# Altium project ArmBand-Control-Board.PrjPcb (part 1 of 3)
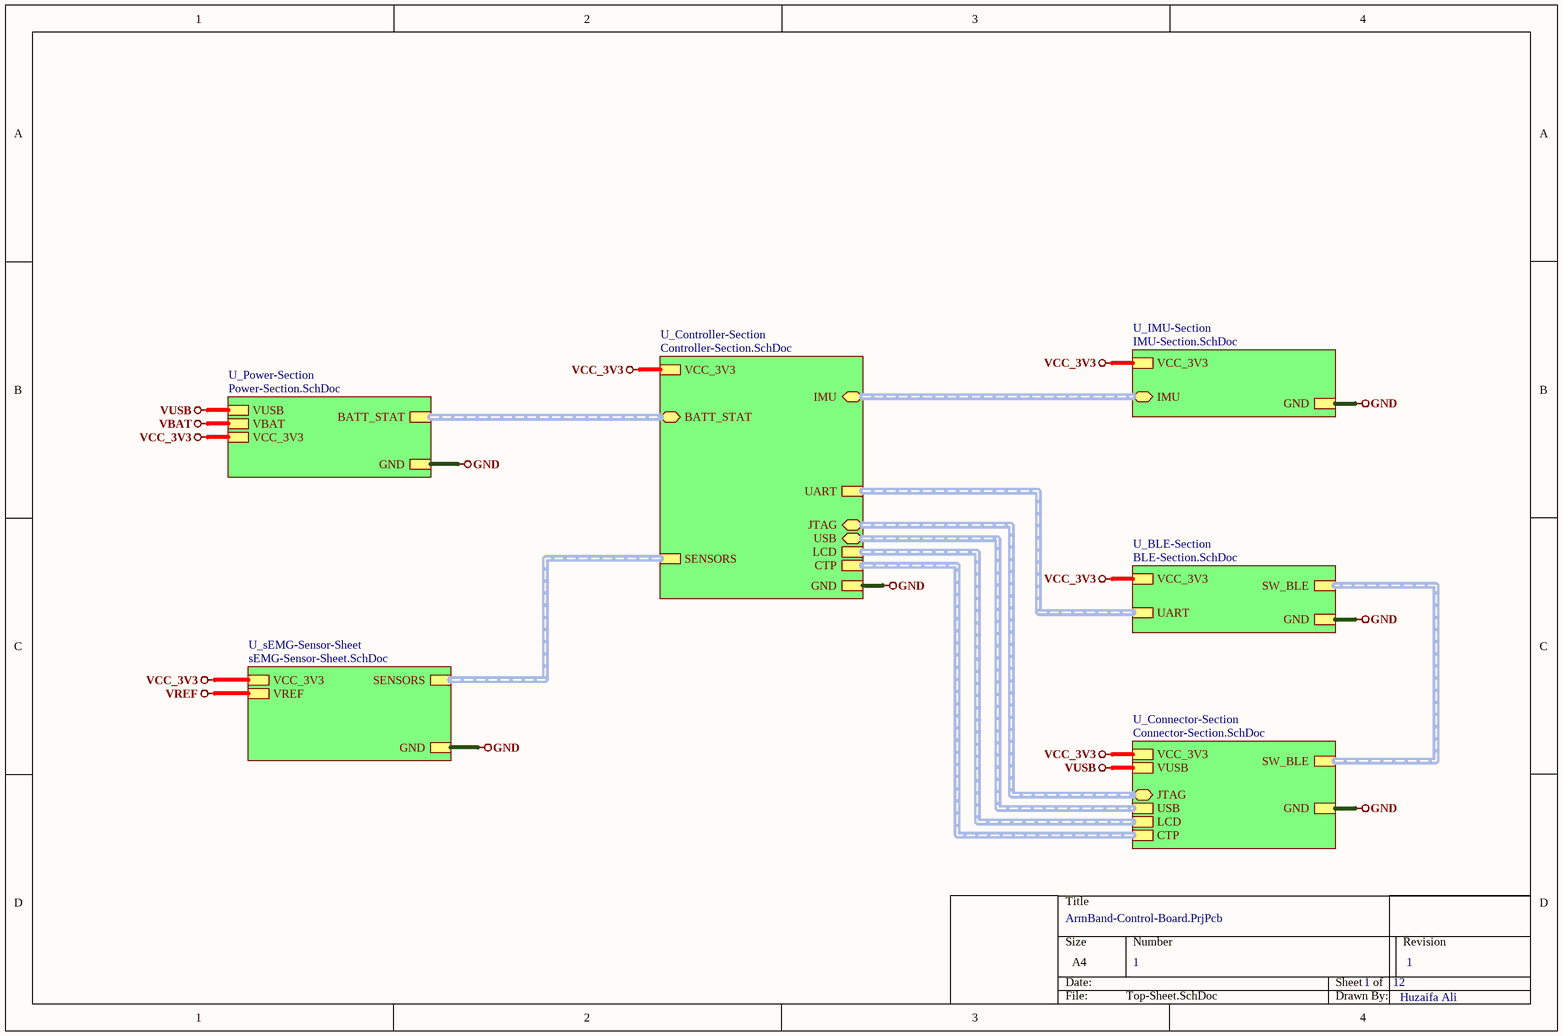
[diagram p0: Top-Sheet.SchDoc]
12 sheets, 184 parts. Net scope: hierarchical (ports join the sheet entries above them; power ports are global).
Board file: ArmBand-Control-Board.PcbDoc
Sheets:
  Top-Sheet.SchDoc
    U_Power-Section = Power-Section.SchDoc
      U_Switching-Regulators = Switching-Regulators.SchDoc
      U_Battery-Charging-Section = Battery-Charging-Section.SchDoc
    U_Controller-Section = Controller-Section.SchDoc
    U_IMU-Section = IMU-Section.SchDoc
    U_BLE-Section = BLE-Section.SchDoc
    U_Connector-Section = Connector-Section.SchDoc
    U_sEMG-Sensor-Sheet = sEMG-Sensor-Sheet.SchDoc
      U_Opamp-Sheet1 = Opamp-Sheet1.SchDoc
      U_Opamp-Sheet2 = Opamp-Sheet2.SchDoc
      U_Filter-Section = Filter-Section.SchDoc

## Sheet Top-Sheet.SchDoc
size A4; SheetNumber: 1; SheetTotal: 12

### Sub-sheets
U_BLE-Section = BLE-Section.SchDoc: UART (harness UART), SW_BLE (harness SW_BLE), VCC_3V3, GND
U_Connector-Section = Connector-Section.SchDoc: SW_BLE (harness SW_BLE), USB (harness USB), VCC_3V3, GND, VUSB, JTAG (bidir, harness JTAG), LCD (harness LCD), CTP (harness CTP)
U_Controller-Section = Controller-Section.SchDoc: BATT_STAT (bidir, harness BATT_STAT), IMU (bidir, harness IMU), USB (bidir, harness USB), VCC_3V3, GND, UART (harness UART), JTAG (bidir, harness JTAG), LCD (harness LCD), CTP (harness CTP), SENSORS (harness SENSORS)
U_IMU-Section = IMU-Section.SchDoc: IMU (bidir, harness IMU), VCC_3V3, GND
U_Power-Section = Power-Section.SchDoc: VUSB, GND, VBAT, VCC_3V3, BATT_STAT (harness BATT_STAT)
U_sEMG-Sensor-Sheet = sEMG-Sensor-Sheet.SchDoc: VCC_3V3, GND, VREF, SENSORS (harness SENSORS)

### Nets
GND: sheet U_Power-Section/GND, sheet U_Controller-Section/GND, sheet U_IMU-Section/GND, sheet U_BLE-Section/GND, sheet U_Connector-Section/GND, sheet U_sEMG-Sensor-Sheet/GND
VCC_3V3: sheet U_Power-Section/VCC_3V3, sheet U_Controller-Section/VCC_3V3, sheet U_IMU-Section/VCC_3V3, sheet U_BLE-Section/VCC_3V3, sheet U_Connector-Section/VCC_3V3, sheet U_sEMG-Sensor-Sheet/VCC_3V3
VUSB: sheet U_Power-Section/VUSB, sheet U_Connector-Section/VUSB

### Buses and harness runs
harness sheet U_BLE-Section/SW_BLE = sheet U_Connector-Section/SW_BLE
harness sheet U_BLE-Section/UART = sheet U_Controller-Section/UART
harness sheet U_Connector-Section/CTP = sheet U_Controller-Section/CTP
harness sheet U_Connector-Section/JTAG = sheet U_Controller-Section/JTAG
harness sheet U_Connector-Section/LCD = sheet U_Controller-Section/LCD
harness sheet U_Connector-Section/USB = sheet U_Controller-Section/USB
harness sheet U_Controller-Section/BATT_STAT = sheet U_Power-Section/BATT_STAT
harness sheet U_Controller-Section/IMU = sheet U_IMU-Section/IMU
harness sheet U_Controller-Section/SENSORS = sheet U_sEMG-Sensor-Sheet/SENSORS

### Notes on the sheet
- 1
- Huzaifa Ali

## Sheet Power-Section.SchDoc
size A4; SheetNumber: 2; SheetTotal: 12
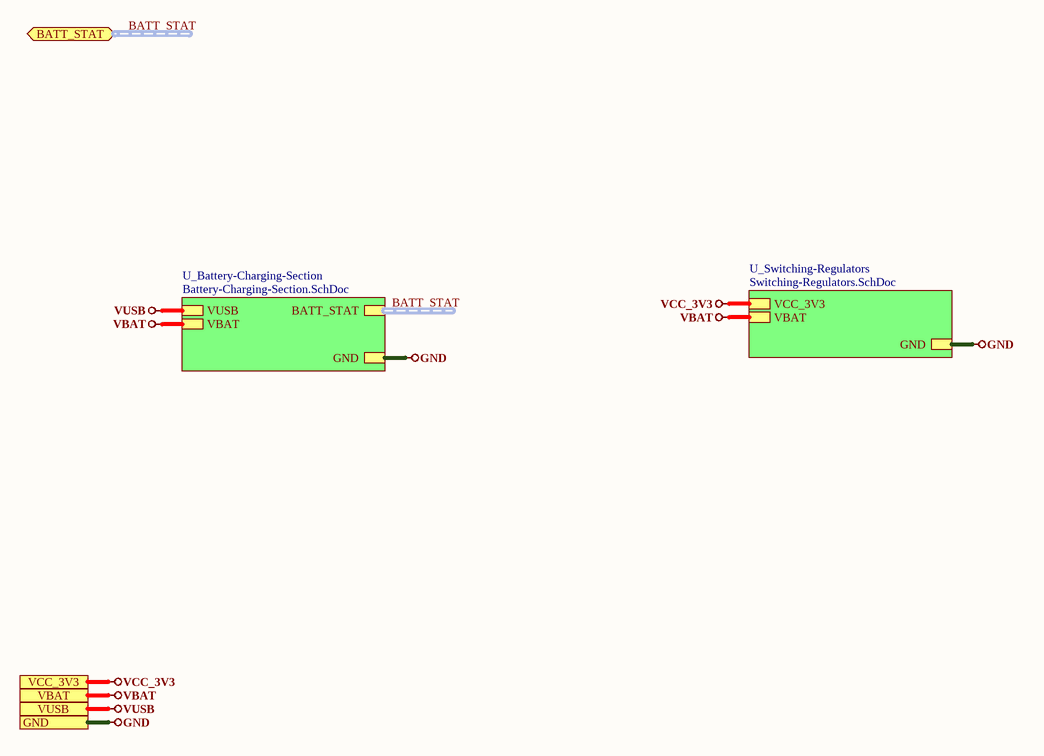
[diagram p1: Power-Section.SchDoc]

### Sub-sheets
U_Battery-Charging-Section = Battery-Charging-Section.SchDoc: BATT_STAT (harness BATT_STAT), VUSB, GND, VBAT
U_Switching-Regulators = Switching-Regulators.SchDoc: VCC_3V3, GND, VBAT

### Ports
BATT_STAT (bidir, harness BATT_STAT), GND, VBAT, VCC_3V3, VUSB

### Nets
GND: port GND, sheet U_Switching-Regulators/GND, sheet U_Battery-Charging-Section/GND
VBAT: port VBAT, sheet U_Switching-Regulators/VBAT, sheet U_Battery-Charging-Section/VBAT
VCC_3V3: port VCC_3V3, sheet U_Switching-Regulators/VCC_3V3
VUSB: port VUSB, sheet U_Battery-Charging-Section/VUSB

### Buses and harness runs
harness BATT_STAT = port BATT_STAT
harness BATT_STAT = sheet U_Battery-Charging-Section/BATT_STAT

### Notes on the sheet
- 1
- Huzaifa Ali

## Sheet Switching-Regulators.SchDoc
size A4; SheetNumber: 4; SheetTotal: 9
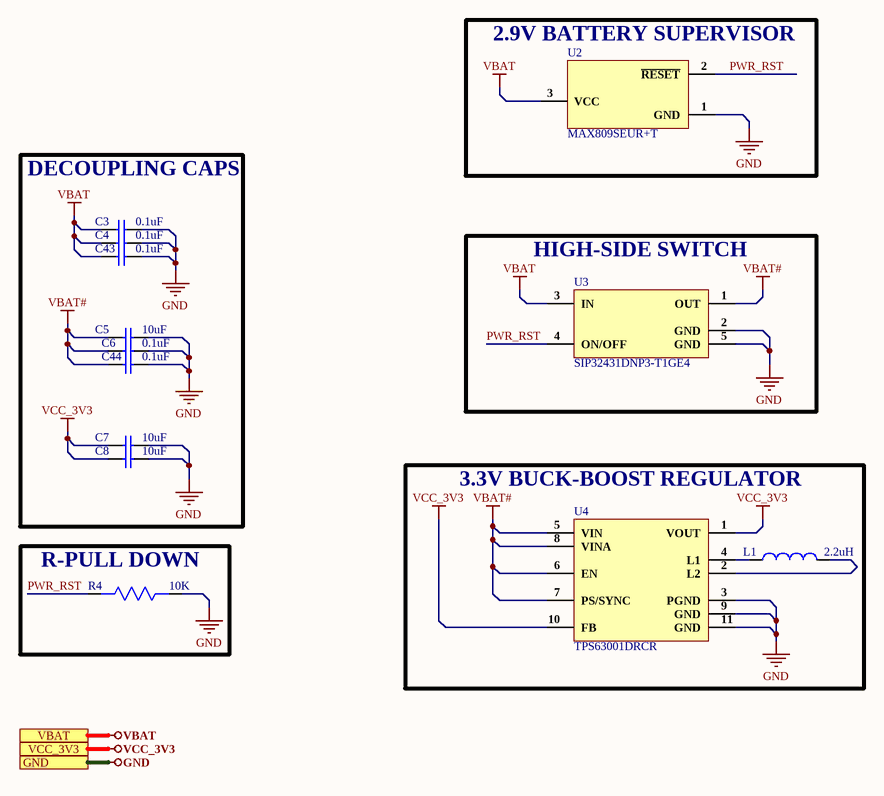
[diagram p2: Switching-Regulators.SchDoc]

### Parts
C3  0.1uF  [Cap 0402]
C4  0.1uF  [Cap 0402]
C5  10uF  [Cap0603]
C6  0.1uF  [Cap 0402]
C7  10uF  [Cap0603]
C8  10uF  [Cap0603]
C43  0.1uF  [Cap 0402]
C44  0.1uF  [Cap 0402]
L1  2.2uH  [MAKK2016T2R2M]
R4  10K  [Res0402]
U2  MAX809SEUR+T  [SOT-23]
U3  SIP32431DNP3-T1GE4  [4-TDFN (1.2x1.6)]
U4  TPS63001DRCR  [10-VSON (3x3)]

### Blocks framed on the sheet
2.9V BATTERY SUPERVISOR: U2
DECOUPLING CAPS: C3-C8 C43 C44
HIGH-SIDE SWITCH: U3
3.3V BUCK-BOOST REGULATOR: L1 U4
R-PULL DOWN: R4

### Ports
GND, VBAT, VCC_3V3

### Nets
GND: C3.2 C4.2 C5.2 C6.2 C7.2 C8.2 C43.2 C44.2 R4.1 U2.1(GND) U3.2(GND) U3.5(GND) U4.3(PGND) U4.9(GND) U4.11(GND) ; port GND
VBAT: C3.1 C4.1 C43.1 U2.3(VCC) U3.3(IN) ; port VBAT
VBAT#: C5.1 C6.1 C44.1 U3.1(OUT) U4.5(VIN) U4.6(EN) U4.7(PS/SYNC) U4.8(VINA)
VCC_3V3: C7.1 C8.1 U4.1(VOUT) U4.10(FB) ; port VCC_3V3
PWR_RST: R4.2 U2.2(~{RESET}) U3.4(ON/OFF)
NetL1_1: L1.1 U4.4(L1)
NetL1_2: L1.2 U4.2(L2)

### Notes on the sheet
- 1
- Huzaifa Ali

### Library data of the parts
C3 C4 C6 C43 C44 = GRM155R71H104ME14D: CAP CER 0.1UF 50V X7R 0402; Manufacturer: Murata; Tolerance: 20%; Capacitance: 100nF; Supplier 1: Digi-Key; Manufacturer Part Number: GRM155R71H104ME14D; Stock 1: 439844; Pricing 1: 1=0.1, 10=0.038, 100=0.0168, 500=0.01198, 1000=0.00941, 2500=0.00855, 5000=0.00787 (USD); Mount: Surface Mount; Case/Package: 0402; Min Operating Temperature: -55°C; Max Operating Temperature: 125°C; Packaging: Cut Tape; Voltage Rating: 50V; Length: 0.039inch; Width: 0.02inch; Thickness: 0.022inch; ComponentLink1URL: http://search.murata.co.jp/Ceramy/image/img/A01X/G101/ENG/GRM155R71H104ME14-01.pdf?src-supplier=Digi-Key; ComponentLink1Description: http://search.murata.co.jp/Ceramy/image/img/A01X/G101/ENG/GRM155R71H104ME14-01.pdf?src-supplier=Digi-Key; ComponentLink2URL: http://psearch.en.murata.com/capacitor/product/GRM155R71H104ME14%23.pdf?src-supplier=Avnet; ComponentLink2Description: http://psearch.en.murata.com/capacitor/product/GRM155R71H104ME14%23.pdf?src-supplier=Avnet; ComponentLink3URL: http://components.arrow.com/part/dataview/0323_07177683?src-supplier=Arrow+Europe; ComponentLink3Description: http://components.arrow.com/part/dataview/0323_07177683?src-supplier=Arrow+Europe; ComponentLink4URL: http://www.mouser.com/ds/2/281/c02e-2905.pdf?src-supplier=Mouser; ComponentLink4Description: http://www.mouser.com/ds/2/281/c02e-2905.pdf?src-supplier=Mouser; Supplier Part Number 1: 490-10701-1-ND
C5 C7 C8 = CL10A106MA8NRNC: CAP CER 10UF 25V X5R 0603; Manufacturer: Samsung; Tolerance: 20%; Supplier 1: Avnet; Manufacturer Part Number: CL10A106MA8NRNC; RoHS: Yes; Category: Ceramic Capacitors; Pricing 1: 4000=0.03753, 8000=0.03700, 16000=0.03595, 24000=0.03515, 32000=0.03383, 40000=0.03304, 400000=0.03225 (USD); Mount: Surface Mount; Case/Package: 0603; Case Code (Metric): 1608; Case Code (Imperial): 0603; Contact Plating: Tin; Min Operating Temperature: -55°C; Max Operating Temperature: 85°C; Package Quantity: 1; Packaging: Tape and Reel; Capacitance: 10uF; Voltage Rating: 25V; Dielectric: X5R; Termination: Wraparound; Series: CL; Construction: Flat; Length: 0.063inch; Width: 0.031inch; Thickness: 0.035inch; Lead Free: Lead Free; RoHS Compliant: Yes; ComponentLink1URL: https://datasheet.ciiva.com/25766/cl10a106ma8nrnc-25766562.pdf?src-supplier=Digi-Key; ComponentLink1Description: https://datasheet.ciiva.com/25766/cl10a106ma8nrnc-25766562.pdf?src-supplier=Digi-Key; Supplier Part Number 1: CL10A106MA8NRNC
L1 = MAKK2016T2R2M: FIXED IND 2.2UH 1.5A 160MOHM SMD; Manufacturer: Taiyo Yuden; Core Material: Metal; Tolerance: 20%; Shielding: Shielded; DC Resistance (DCR): 160mR; Test Frequency: 2MHz; Supplier 1: Mouser; Manufacturer Part Number: MAKK2016T2R2M; RoHS: Yes; Category: Fixed Inductors; Stock 1: 64320; Pricing 1: 1=0.27000, 10=0.17200, 50=0.17200, 100=0.14000, 1000=0.10600, 10000=0.09200 (USD); Mount: Surface Mount; Case/Package: 0806; Case Code (Metric): 2016; Case Code (Imperial): 0806; Min Operating Temperature: -40°C; Max Operating Temperature: 105°C; Packaging: Tape and Reel; Package Quantity: 3000; Resistor Type: Wirewound; Inductance: 2.2uH; Current Rating: 1.5A; Saturation Current: 1.5A; Max DC Current: 1.5A; Termination: SMD/SMT; Length: 0.079inch; Width: 0.063inch; Height: 1mm; Height - Seated (Max): 0.039inch; Depth: 1.6mm; Radiation Hardening: No; Halogen Free: Halogen Free; RoHS Compliant: Yes; ComponentLink1URL: https://datasheet.ciiva.com/30014/makk2016t2r2m-ss-30014449.pdf?src-supplier=Avnet; ComponentLink1Description: https://datasheet.ciiva.com/30014/makk2016t2r2m-ss-30014449.pdf?src-supplier=Avnet; Supplier Part Number 1: 963-MAKK2016T2R2M
R4 = RC0402FR-0710KL: RES SMD 10K OHM 1% 1/16W 0402; Manufacturer: Yageo; Resistance: 10kR; Temperature Coefficient: 100ppm/°C; Voltage Rating (DC): 50V; Power Rating: 62.5mW; Supplier 1: Digi-Key; Manufacturer Part Number: RC0402FR-0710KL; Stock 1: 60122563; Pricing 1: 1=0.1, 10=0.016, 100=0.0064, 1000=0.00289, 2500=0.00251, 5000=0.00207 (USD); Case/Package: 0402; Number of Pins: 2; Case Code (Imperial): 0402; Case Code (Metric): 1005; Min Operating Temperature: -55°C; Max Operating Temperature: 155°C; Composition: Thick Film; Tolerance: 1%; Packaging: Tape and Reel; Voltage Rating: 50V; Termination: SMD/SMT; Military Standard: Not; Working Voltage: 50V; Number of Terminations: 2; Length: 1mm; Height: 0.32mm; Width: 0.5mm; Depth: 0.5mm; Lead Pitch: 0.2mm; REACH SVHC: No SVHC; Lead Free: Lead Free; ComponentLink1URL: http://www.farnell.com/datasheets/2167052.pdf?src-supplier=Element14; ComponentLink1Description: http://www.farnell.com/datasheets/2167052.pdf?src-supplier=Element14; ComponentLink2URL: http://www.farnell.com/datasheets/1686128.pdf?src-supplier=Element14; ComponentLink2Description: http://www.farnell.com/datasheets/1686128.pdf?src-supplier=Element14; ComponentLink3URL: http://www.farnell.com/datasheets/1784430.pdf?src-supplier=Element14; ComponentLink3Description: http://www.farnell.com/datasheets/1784430.pdf?src-supplier=Element14; ComponentLink4URL: http://www.yageo.com/documents/recent/PYu-RC_Group_51_RoHS_L_9.pdf?src-supplier=Mouser; ComponentLink4Description: http://www.yageo.com/documents/recent/PYu-RC_Group_51_RoHS_L_9.pdf?src-supplier=Mouser; Supplier Part Number 1: 311-10.0KLRDKR-ND
U2 = MAX809SEUR+T: IC MPU/RESET CIRC SOT23-3; Manufacturer: Maxim; Min Supply Voltage: 1.2V; Max Supply Voltage: 5.5V; Max Power Dissipation: 320mW; Number of Voltages Monitored: 1; Reset: Active Low; Reset Timeout: 140ms; Threshold Voltage: 2.93V; Watchdog Timer: No; Min Reset Threshold Voltage: 2.89V; Max Reset Threshold Voltage: 2.96V; Output: TOTEM-POLE; Operating Supply Current: 60uA; Max Output Current: 20mA; Nominal Supply Current: 17uA; Output Type: PUSH-PULL; Supplier 1: Mouser; Manufacturer Part Number: MAX809SEUR+T; RoHS: Yes; Category: Voltage Supervisors; Stock 1: 26180; Pricing 1: 1=3.68000, 10=3.31000, 25=3.13000, 50=3.13000, 100=2.72000, 250=2.58000, 500=2.31000, 1000=2.09000, 10000=2.01000 (USD); Mount: Surface Mount; Case/Package: SOT-23; Number of Pins: 3; Min Operating Temperature: -40°C; Max Operating Temperature: 105°C; Type: Simple Reset/Power-On Reset; Packaging: Cut Tape; Package Quantity: 1; Series: -; Overvoltage Threshold: 2.96V; Undervoltage Threshold: 2.89V; Termination: SMD/SMT; Power Dissipation: 320mW; Length: 2.92mm; Width: 1.3mm; Height: 0.94mm; Radiation Hardening: No; Lead Free: Lead Free; RoHS Compliant: Yes; REACH SVHC: No SVHC; ComponentLink1URL: https://datasheet.ciiva.com/1169/max803-max810z-1169879.pdf?src-supplier=Element14; ComponentLink1Description: https://datasheet.ciiva.com/1169/max803-max810z-1169879.pdf?src-supplier=Element14; ComponentLink2URL: https://datasheet.ciiva.com/1169/max803-max810z-1169878.pdf?src-supplier=Element14; ComponentLink2Description: https://datasheet.ciiva.com/1169/max803-max810z-1169878.pdf?src-supplier=Element14; ComponentLink3URL: https://datasheet.ciiva.com/14226/max803-max810z-14226330.pdf?src-supplier=Avnet; ComponentLink3Description: https://datasheet.ciiva.com/14226/max803-max810z-14226330.pdf?src-supplier=Avnet; ComponentLink4URL: https://datasheet.ciiva.com/1973/max803-max810z-1973322.pdf?src-supplier=Digi-Key; ComponentLink4Description: https://datasheet.ciiva.com/1973/max803-max810z-1973322.pdf?src-supplier=Digi-Key; ComponentLink5URL: https://datasheet.ciiva.com/1973/max803-max810z-1973323.pdf?src-supplier=Digi-Key; ComponentLink5Description: https://datasheet.ciiva.com/1973/max803-max810z-1973323.pdf?src-supplier=Digi-Key; ComponentLink6URL: https://datasheet.ciiva.com/1973/max803-max810z-1973321.pdf?src-supplier=Digi-Key; ComponentLink6Description: https://datasheet.ciiva.com/1973/max803-max810z-1973321.pdf?src-supplier=Digi-Key; Supplier Part Number 1: 700-MAX809SEURT
U3 = SIP32431DNP3-T1GE4: IC SWITCH HIGH SIDE 4TDFN; Manufacturer: Vishay Siliconix; Output Current: 1A; Number of Outputs: 1; Max Power Dissipation: 324mW; Max Supply Voltage: 5.5V; Min Supply Voltage: 1.1V; Interface: On/Off; Max Output Current: 1.4A; On-State Resistance: 520mR; Turn-Off Delay Time: 10us; Turn-On Delay Time: 40us; Fault Protection: Reverse Current; Supplier 1: Arrow Electronics; Manufacturer Part Number: SIP32431DNP3-T1GE4; RoHS: Yes; Category: Hot Swap Controllers; Stock 1: 2913; Pricing 1: 1=0.66250, 10=0.57780, 25=0.57210, 100=0.43730, 250=0.41140, 500=0.34220, 1000=0.27210, 3000=0.25500 (USD); Mount: Surface Mount; Number of Pins: 4; Weight: 0.001764oz; Min Operating Temperature: -40°C; Max Operating Temperature: 85°C; Packaging: Tape and Reel; Package Quantity: 3000; Power Dissipation: 324mW; Output Configuration: High Side; Series: SIP324x1; Radiation Hardening: No; Lead Free: Lead Free; RoHS Compliant: Yes; ComponentLink1URL: https://datasheet.ciiva.com/15109/getdatasheetpartid-704627-15109219.pdf?src-supplier=Verical; ComponentLink1Description: https://datasheet.ciiva.com/15109/getdatasheetpartid-704627-15109219.pdf?src-supplier=Verical; ComponentLink2URL: https://datasheet.ciiva.com/1954/sip32431-1954885.pdf?src-supplier=Digi-Key; ComponentLink2Description: https://datasheet.ciiva.com/1954/sip32431-1954885.pdf?src-supplier=Digi-Key; Supplier Part Number 1: SIP32431DNP3-T1GE4
U4 = TPS63001DRCR: IC REG BUCK BST 3.3V 1.6A 10SON; Manufacturer: Texas Instruments; Switching Frequency: 1.5MHz; Efficiency: 96%; Number of Outputs: 1; Output Current: 1.2A; Max Input Voltage: 5.5V; Min Input Voltage: 1.8V; Synchronous Rectifier: Yes; Quiescent Current: 30uA; Output Type: Fixed; Topology: Buck-Boost; Supplier 1: Mouser; Manufacturer Part Number: TPS63001DRCR; RoHS: Yes; Category: Voltage Regulators - Switching; Pricing 1: 1=2.67000, 10=2.41000, 50=2.27000, 100=1.94000, 1000=1.32000, 10000=1.32000 (USD); Number of Pins: 10; Weight: 0.000921oz; Contact Plating: Gold; Min Operating Temperature: -40°C; Max Operating Temperature: 85°C; Packaging: Tape and Reel; Output Voltage: 3.3V; Package Quantity: 1; Max Output Current: 1.2A; Min Output Voltage: 3.3V; Max Output Voltage: 3.3V; Operating Supply Voltage: 5.5V; Nominal Output Voltage: 3.3V; Radiation Hardening: No; Lead Free: Lead Free; RoHS Compliant: Yes; REACH SVHC: No SVHC; ComponentLink1URL: https://datasheet.ciiva.com/2025/tps63001-2025809.pdf?src-supplier=Digi-Key; ComponentLink1Description: https://datasheet.ciiva.com/2025/tps63001-2025809.pdf?src-supplier=Digi-Key; ComponentLink2URL: https://datasheet.ciiva.com/3220/slvs520b-3220364.pdf?src-supplier=Avnet; ComponentLink2Description: https://datasheet.ciiva.com/3220/slvs520b-3220364.pdf?src-supplier=Avnet; ComponentLink3URL: https://datasheet.ciiva.com/15113/getdatasheetpartid-188339-15113751.pdf?src-supplier=Verical; ComponentLink3Description: https://datasheet.ciiva.com/15113/getdatasheetpartid-188339-15113751.pdf?src-supplier=Verical; ComponentLink4URL: https://datasheet.ciiva.com/41462/001014938-da-01-en-ic-reg-buck-bst-tps63001drcr-vson-10-tid-41462783.pdf?src-supplier=Conrad; ComponentLink4Description: https://datasheet.ciiva.com/41462/001014938-da-01-en-ic-reg-buck-bst-tps63001drcr-vson-10-tid-41462783.pdf?src-supplier=Conrad; ComponentLink5URL: https://datasheet.ciiva.com/7994/1831174-7994044.pdf?src-supplier=Element14; ComponentLink5Description: https://datasheet.ciiva.com/7994/1831174-7994044.pdf?src-supplier=Element14; ComponentLink6URL: https://datasheet.ciiva.com/46394/1854797-46394566.pdf?src-supplier=Element14; ComponentLink6Description: https://datasheet.ciiva.com/46394/1854797-46394566.pdf?src-supplier=Element14; ComponentLink7URL: https://datasheet.ciiva.com/2025/tps63001-2025813.pdf?src-supplier=Digi-Key; ComponentLink7Description: https://datasheet.ciiva.com/2025/tps63001-2025813.pdf?src-supplier=Digi-Key; ComponentLink8URL: https://datasheet.ciiva.com/2025/tps63001-2025812.pdf?src-supplier=Digi-Key; ComponentLink8Description: https://datasheet.ciiva.com/2025/tps63001-2025812.pdf?src-supplier=Digi-Key; ComponentLink9URL: https://datasheet.ciiva.com/3220/tps63001-3220363.pdf?src-supplier=Avnet; ComponentLink9Description: https://datasheet.ciiva.com/3220/tps63001-3220363.pdf?src-supplier=Avnet; Supplier Part Number 1: 595-TPS63001DRCR

## Sheet Battery-Charging-Section.SchDoc
size A4; SheetNumber: 3; SheetTotal: 12
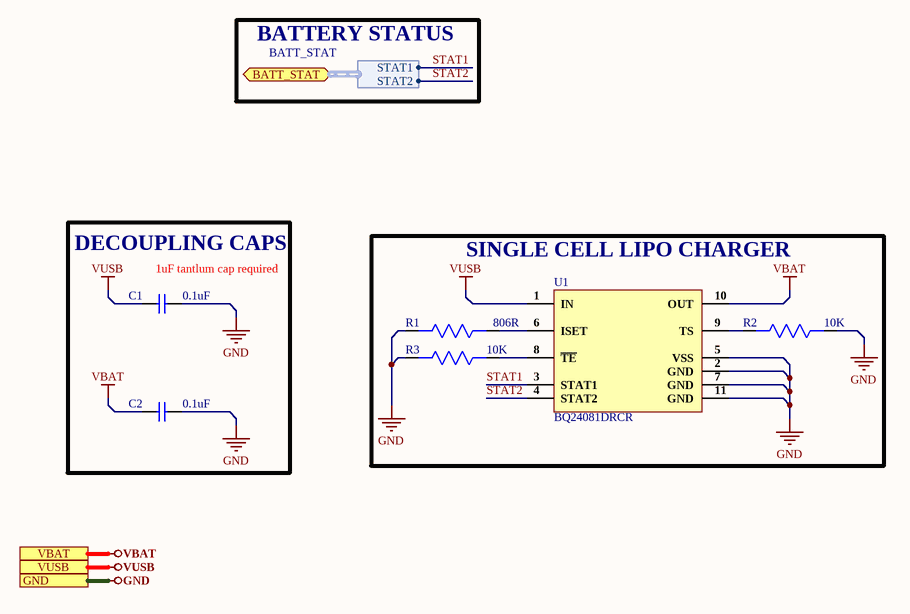
[diagram p3: Battery-Charging-Section.SchDoc]

### Parts
C1  0.1uF  [Cap 0402]
C2  0.1uF  [Cap 0402]
R1  806R  [Res0402]
R2  10K  [Res0402]
R3  10K  [Res0402]
U1  BQ24081DRCR  [10-VSON (3x3)]

### Blocks framed on the sheet
DECOUPLING CAPS: C1 C2
SINGLE CELL LIPO CHARGER: R1-R3 U1

### Ports
BATT_STAT (bidir, harness BATT_STAT), GND, VBAT, VUSB

### Harnesses
BATT_STAT: STAT1, STAT2

### Nets
GND: C1.2 C2.2 R1.2 R2.1 R3.2 U1.2(GND) U1.5(VSS) U1.7(GND) U1.11(GND) ; port GND
VBAT: C2.1 U1.10(OUT) ; port VBAT
VUSB: C1.1 U1.1(IN) ; port VUSB
STAT1: U1.3(STAT1) ; port BATT_STAT.STAT1  [project net BATT_STAT.STAT1]
STAT2: U1.4(STAT2) ; port BATT_STAT.STAT2  [project net BATT_STAT.STAT2]
NetR1_1: R1.1 U1.6(ISET)
NetR2_2: R2.2 U1.9(TS)
NetR3_1: R3.1 U1.8(~{TE})

### Notes on the sheet
- BATTERY STATUS
- (near C1) 1uF tantlum cap required
- 1
- Huzaifa Ali

### Library data of the parts
C1 C2 = GRM155R71H104ME14D: as C3 on sheet Switching-Regulators; Supplier 1: Digi-Key; Manufacturer Part Number: GRM155R71H104ME14D; Stock 1: 439844; Pricing 1: 1=0.1, 10=0.038, 100=0.0168, 500=0.01198, 1000=0.00941, 2500=0.00855, 5000=0.00787 (USD); Mount: Surface Mount; Case/Package: 0402; Min Operating Temperature: -55°C; Max Operating Temperature: 125°C; Packaging: Cut Tape; Voltage Rating: 50V; Length: 0.039inch; Width: 0.02inch; Thickness: 0.022inch; ComponentLink1URL: http://search.murata.co.jp/Ceramy/image/img/A01X/G101/ENG/GRM155R71H104ME14-01.pdf?src-supplier=Digi-Key; ComponentLink1Description: http://search.murata.co.jp/Ceramy/image/img/A01X/G101/ENG/GRM155R71H104ME14-01.pdf?src-supplier=Digi-Key; ComponentLink2URL: http://psearch.en.murata.com/capacitor/product/GRM155R71H104ME14%23.pdf?src-supplier=Avnet; ComponentLink2Description: http://psearch.en.murata.com/capacitor/product/GRM155R71H104ME14%23.pdf?src-supplier=Avnet; ComponentLink3URL: http://components.arrow.com/part/dataview/0323_07177683?src-supplier=Arrow+Europe; ComponentLink3Description: http://components.arrow.com/part/dataview/0323_07177683?src-supplier=Arrow+Europe; ComponentLink4URL: http://www.mouser.com/ds/2/281/c02e-2905.pdf?src-supplier=Mouser; ComponentLink4Description: http://www.mouser.com/ds/2/281/c02e-2905.pdf?src-supplier=Mouser; Supplier Part Number 1: 490-10701-1-ND
R1 = AC0402FR-07806RL: RES SMD 806 OHM 1% 1/16W 0402; Manufacturer: Yageo; Max Power Dissipation: 63mW; Temperature Coefficient: 100ppm/°C; Supplier 1: Arrow Electronics; Manufacturer Part Number: AC0402FR-07806RL; RoHS: Yes; Category: Chip SMD Resistors; Stock 1: 6997; Pricing 1: 1=0.04340, 10=0.00890, 25=0.00880, 100=0.00370, 250=0.00360, 1000=0.00210, 3000=0.00140, 6000=0.00110 (USD); Case/Package: 0402; Min Operating Temperature: -55°C; Max Operating Temperature: 155°C; Packaging: Tape and Reel; Resistance: 806R; Resistor Type: Thick Film; Number of Terminations: 2; Tolerance: 1%; Features: Moisture Resistant,Automotive AEC-Q200; Length: 0.039inch; Width: 0.02inch; Height: 0.015inch; RoHS Compliant: Yes; ComponentLink1URL: http://www.yageo.com/NewPortal/yageodocoutput?fileName=/pdf/R-Chip/PYu-AC_51_RoHS_L_6.pdf&src-supplier=Digi-Key; ComponentLink1Description: http://www.yageo.com/NewPortal/yageodocoutput?fileName=/pdf/R-Chip/PYu-AC_51_RoHS_L_6.pdf&src-supplier=Digi-Key; ComponentLink2URL: https://www.yageo.com/upload/media/product/productsearch/datasheet/rchip/PYu-AC_51_RoHS_L_7.pdf?src-supplier=Digi-Key; ComponentLink2Description: https://www.yageo.com/upload/media/product/productsearch/datasheet/rchip/PYu-AC_51_RoHS_L_7.pdf?src-supplier=Digi-Key; Supplier Part Number 1: AC0402FR-07806RL
R2 R3 = RC0402FR-0710KL: as R4 on sheet Switching-Regulators; Supplier 1: Digi-Key; Manufacturer Part Number: RC0402FR-0710KL; Stock 1: 60122563; Pricing 1: 1=0.1, 10=0.016, 100=0.0064, 1000=0.00289, 2500=0.00251, 5000=0.00207 (USD); Case/Package: 0402; Number of Pins: 2; Case Code (Imperial): 0402; Case Code (Metric): 1005; Min Operating Temperature: -55°C; Max Operating Temperature: 155°C; Composition: Thick Film; Tolerance: 1%; Packaging: Tape and Reel; Voltage Rating: 50V; Termination: SMD/SMT; Military Standard: Not; Working Voltage: 50V; Number of Terminations: 2; Length: 1mm; Height: 0.32mm; Width: 0.5mm; Depth: 0.5mm; Lead Pitch: 0.2mm; REACH SVHC: No SVHC; Lead Free: Lead Free; ComponentLink1URL: http://www.farnell.com/datasheets/2167052.pdf?src-supplier=Element14; ComponentLink1Description: http://www.farnell.com/datasheets/2167052.pdf?src-supplier=Element14; ComponentLink2URL: http://www.farnell.com/datasheets/1686128.pdf?src-supplier=Element14; ComponentLink2Description: http://www.farnell.com/datasheets/1686128.pdf?src-supplier=Element14; ComponentLink3URL: http://www.farnell.com/datasheets/1784430.pdf?src-supplier=Element14; ComponentLink3Description: http://www.farnell.com/datasheets/1784430.pdf?src-supplier=Element14; ComponentLink4URL: http://www.yageo.com/documents/recent/PYu-RC_Group_51_RoHS_L_9.pdf?src-supplier=Mouser; ComponentLink4Description: http://www.yageo.com/documents/recent/PYu-RC_Group_51_RoHS_L_9.pdf?src-supplier=Mouser; Supplier Part Number 1: 311-10.0KLRDKR-ND
U1 = BQ24081DRCR: IC BATT CHG LI-ION 1CELL 10VSON; Manufacturer: Texas Instruments; Output Voltage: 4.2V; Min Supply Voltage: 4.5V; Max Supply Voltage: 6.5V; Output Current: 1A; Number of Cells: 1; Supplier 1: Mouser; Manufacturer Part Number: BQ24081DRCR; RoHS: Yes; Category: Battery Management; Pricing 1: 1=1.80000, 10=1.62000, 50=1.53000, 100=1.31000, 1000=0.88800, 10000=0.88700 (USD); Mount: Surface Mount; Case/Package: VSON; Number of Pins: 10; Weight: 0.000921oz; Contact Plating: Gold; Min Operating Temperature: -40°C; Max Operating Temperature: 125°C; Package Quantity: 1; Packaging: Tape and Reel; Series: -; Radiation Hardening: No; Lead Free: Lead Free; RoHS Compliant: Yes; ComponentLink1URL: https://datasheet.ciiva.com/15114/getdatasheetpartid-418523-15114727.pdf?src-supplier=Verical; ComponentLink1Description: https://datasheet.ciiva.com/15114/getdatasheetpartid-418523-15114727.pdf?src-supplier=Verical; ComponentLink2URL: https://datasheet.ciiva.com/1932/bq24081-1932210.pdf?src-supplier=Digi-Key; ComponentLink2Description: https://datasheet.ciiva.com/1932/bq24081-1932210.pdf?src-supplier=Digi-Key; ComponentLink3URL: https://datasheet.ciiva.com/1932/bq24081-1932209.pdf?src-supplier=Digi-Key; ComponentLink3Description: https://datasheet.ciiva.com/1932/bq24081-1932209.pdf?src-supplier=Digi-Key; ComponentLink4URL: https://datasheet.ciiva.com/1932/bq24081-1932211.pdf?src-supplier=Digi-Key; ComponentLink4Description: https://datasheet.ciiva.com/1932/bq24081-1932211.pdf?src-supplier=Digi-Key; ComponentLink5URL: https://datasheet.ciiva.com/3214/bq24080-3214060.pdf?src-supplier=Avnet; ComponentLink5Description: https://datasheet.ciiva.com/3214/bq24080-3214060.pdf?src-supplier=Avnet; Supplier Part Number 1: 595-BQ24081DRCR

## Sheet Controller-Section.SchDoc
size A4; SheetNumber: 5; SheetTotal: 12
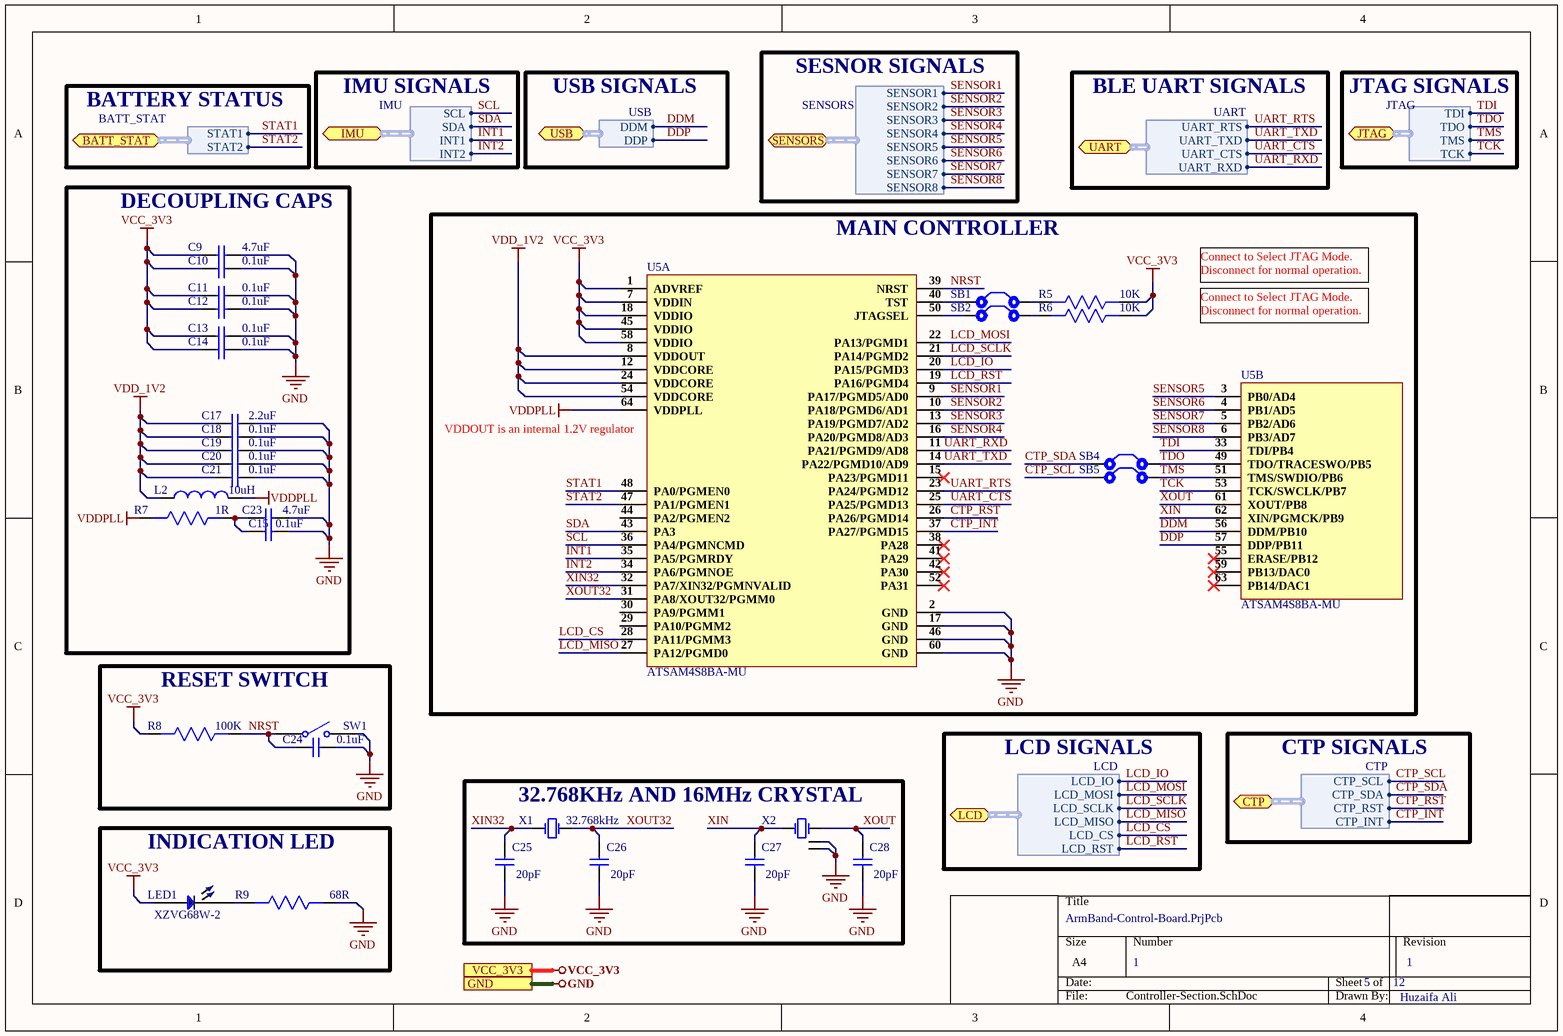
[diagram p4: Controller-Section.SchDoc]

### Parts
C9  4.7uF  [Cap 0402]
C10  0.1uF  [Cap 0402]
C11  0.1uF  [Cap 0402]
C12  0.1uF  [Cap 0402]
C13  0.1uF  [Cap 0402]
C14  0.1uF  [Cap 0402]
C15  0.1uF  [Cap 0402]
C17  2.2uF  [Cap 0402]
C18  0.1uF  [Cap 0402]
C19  0.1uF  [Cap 0402]
C20  0.1uF  [Cap 0402]
C21  0.1uF  [Cap 0402]
C23  4.7uF  [Cap 0402]
C24  0.1uF  [Cap 0402]
C25  20pF  [Cap 0402]
C26  20pF  [Cap 0402]
C27  20pF  [Cap 0402]
C28  20pF  [Cap 0402]
L2  10uH  [NLCV25T-100K-EFRD]
LED1  XZVG68W-2  [LED 0402]
R5  10K  [Res0402]
R6  10K  [Res0402]
R7  1R  [Res0402]
R8  100K  [Res0402]
R9  68R  [Res0402]
SB1  Solder Bridge  [Solder Bridge]  (value not drawn)
SB2  Solder Bridge  [Solder Bridge]  (value not drawn)
SB4  Solder Bridge  [Solder Bridge]  (value not drawn)
SB5  Solder Bridge  [Solder Bridge]  (value not drawn)
SW1  TS-1185EC-C-D-B  [TS-1185EC-C-D-B]  (value not drawn)
U5  ATSAM4S8BA-MU  [QFN-64]  (parts A,B of 2)
X1  32.768kHz  [X321532768KGD2SI]
X2  16MHz  [X322516MOB4SI]  (value not drawn)

### Blocks framed on the sheet
DECOUPLING CAPS: C9-C15 C17-C21 C23 L2 R7
MAIN CONTROLLER: R5 R6 SB1 SB2 SB4 SB5 U5
RESET SWITCH: C24 R8 SW1
32.768KHz AND 16MHz CRYSTAL: C25-C28 X1 X2
INDICATION LED: LED1 R9

### Ports
BATT_STAT (bidir, harness BATT_STAT), CTP (bidir, harness CTP), GND, IMU (bidir, harness IMU), JTAG (bidir, harness JTAG), LCD (bidir, harness LCD), SENSORS (bidir, harness SENSORS), UART (bidir, harness UART), USB (bidir, harness USB), VCC_3V3

### Harnesses
IMU: SCL, SDA, INT1, INT2
USB: DDM, DDP
BATT_STAT: STAT1, STAT2
JTAG: TDI, TDO, TMS, TCK
LCD: LCD_IO, LCD_MOSI, LCD_SCLK, LCD_MISO, LCD_CS, LCD_RST
CTP: CTP_SCL, CTP_SDA, CTP_RST, CTP_INT
UART: UART_RTS, UART_TXD, UART_CTS, UART_RXD
SENSORS: SENSOR1, SENSOR2, SENSOR3, SENSOR4, SENSOR5, SENSOR6, SENSOR7, SENSOR8

### Nets
GND: C9.2 C10.2 C11.2 C12.2 C13.2 C14.2 C15.2 C17.2 C18.2 C19.2 C20.2 C21.2 C23.2 C24.2 C25.1 C26.1 C27.1 C28.1 R9.1 SW1.2 U5.2(GND) U5.17(GND) U5.46(GND) U5.60(GND) X2.2(GND) X2.4(GND) ; port GND
VCC_3V3: C9.1 C10.1 C11.1 C12.1 C13.1 C14.1 LED1.1 R5.1 R6.1 R8.2 U5.1(ADVREF) U5.7(VDDIN) U5.18(VDDIO) U5.45(VDDIO) U5.58(VDDIO) ; port VCC_3V3
VDD_1V2: C17.1 C18.1 C19.1 C20.1 C21.1 L2.1 U5.8(VDDOUT) U5.12(VDDCORE) U5.24(VDDCORE) U5.54(VDDCORE)
VDDPLL: L2.2 R7.2 U5.64(VDDPLL)
CTP_INT: U5.37(PA27/PGMD15) ; port CTP.CTP_INT
CTP_RST: U5.26(PA26/PGMD14) ; port CTP.CTP_RST
CTP_SCL: SB5.1 ; port CTP.CTP_SCL
CTP_SDA: SB4.1 ; port CTP.CTP_SDA
DDM: U5.56(DDM/PB10) ; port USB.DDM
DDP: U5.57(DDP/PB11) ; port USB.DDP
INT1: U5.35(PA5/PGMRDY) ; port IMU.INT1
INT2: U5.34(PA6/PGMNOE) ; port IMU.INT2
LCD_CS: U5.28(PA11/PGMM3) ; port LCD.LCD_CS
LCD_IO: U5.20(PA15/PGMD3) ; port LCD.LCD_IO
LCD_MISO: U5.27(PA12/PGMD0) ; port LCD.LCD_MISO
LCD_MOSI: U5.22(PA13/PGMD1) ; port LCD.LCD_MOSI
LCD_RST: U5.19(PA16/PGMD4) ; port LCD.LCD_RST
LCD_SCLK: U5.21(PA14/PGMD2) ; port LCD.LCD_SCLK
NRST: C24.1 R8.1 SW1.1 U5.39(NRST)
SCL: U5.36(PA4/PGMNCMD) ; port IMU.SCL
SDA: U5.43(PA3) ; port IMU.SDA
SENSOR1: U5.9(PA17/PGMD5/AD0) ; port SENSORS.SENSOR1
SENSOR2: U5.10(PA18/PGMD6/AD1) ; port SENSORS.SENSOR2
SENSOR3: U5.13(PA19/PGMD7/AD2) ; port SENSORS.SENSOR3
SENSOR4: U5.16(PA20/PGMD8/AD3) ; port SENSORS.SENSOR4
SENSOR5: U5.3(PB0/AD4) ; port SENSORS.SENSOR5
SENSOR6: U5.4(PB1/AD5) ; port SENSORS.SENSOR6
SENSOR7: U5.5(PB2/AD6) ; port SENSORS.SENSOR7
SENSOR8: U5.6(PB3/AD7) ; port SENSORS.SENSOR8
STAT1: U5.48(PA0/PGMEN0) ; port BATT_STAT.STAT1  [project net BATT_STAT.STAT1]
STAT2: U5.47(PA1/PGMEN1) ; port BATT_STAT.STAT2  [project net BATT_STAT.STAT2]
TCK: U5.53(TCK/SWCLK/PB7) ; port JTAG.TCK
TDI: U5.33(TDI/PB4) ; port JTAG.TDI
TDO: SB4.2 U5.49(TDO/TRACESWO/PB5) ; port JTAG.TDO
TMS: SB5.2 U5.51(TMS/SWDIO/PB6) ; port JTAG.TMS
UART_CTS: U5.25(PA25/PGMD13) ; port UART.UART_CTS
UART_RTS: U5.23(PA24/PGMD12) ; port UART.UART_RTS
UART_RXD: U5.11(PA21/PGMD9/AD8) ; port UART.UART_RXD
UART_TXD: U5.14(PA22/PGMD10/AD9) ; port UART.UART_TXD
XIN: C27.2 U5.62(XIN/PGMCK/PB9) X2.1(OSC1)
XIN32: C25.2 U5.32(PA7/XIN32/PGMNVALID) X1.1(OSC1)
XOUT: C28.2 U5.61(XOUT/PB8) X2.3(OSC2)
XOUT32: C26.2 U5.31(PA8/XOUT32/PGMM0) X1.2(OSC2)
NetC15_1: C15.1 C23.1 R7.1
NetLED1_2: LED1.2 R9.2
NetR5_2: R5.2 SB1.2
NetR6_2: R6.2 SB2.2
NetSB1_1: SB1.1 U5.40(TST)
NetSB2_1: SB2.1 U5.50(JTAGSEL)

Not connected (* = marked no-connect by the designer): U5 15(PA23/PGMD11)* 29(PA10/PGMM2) 30(PA9/PGMM1) 38(PA28)* 41(PA29)* 42(PA30)* 44(PA2/PGMEN2) 52(PA31)* 55(ERASE/PB12)* 59(PB13/DAC0)* 63(PB14/DAC1)*

### Notes on the sheet
- BATTERY STATUS
- IMU SIGNALS
- USB SIGNALS
- SESNOR SIGNALS
- BLE UART SIGNALS
- JTAG SIGNALS
- Connect to Select JTAG Mode. Disconnect for normal operation.
- (near U5) VDDOUT is an internal 1.2V regulator
- LCD SIGNALS
- CTP SIGNALS
- 1
- Huzaifa Ali

### Library data of the parts
C9 C23 = EDK105BBJ475MVLF: 16V 4.7uF ±20% 0402 Multilayer Ceramic Capacitors MLCC
C10-C15 C18-C21 C24 = GRM155R71H104ME14D: as C3 on sheet Switching-Regulators; Supplier 1: Digi-Key; Manufacturer Part Number: GRM155R71H104ME14D; Stock 1: 439844; Pricing 1: 1=0.1, 10=0.038, 100=0.0168, 500=0.01198, 1000=0.00941, 2500=0.00855, 5000=0.00787 (USD); Mount: Surface Mount; Case/Package: 0402; Min Operating Temperature: -55°C; Max Operating Temperature: 125°C; Packaging: Cut Tape; Voltage Rating: 50V; Length: 0.039inch; Width: 0.02inch; Thickness: 0.022inch; ComponentLink1URL: http://search.murata.co.jp/Ceramy/image/img/A01X/G101/ENG/GRM155R71H104ME14-01.pdf?src-supplier=Digi-Key; ComponentLink1Description: http://search.murata.co.jp/Ceramy/image/img/A01X/G101/ENG/GRM155R71H104ME14-01.pdf?src-supplier=Digi-Key; ComponentLink2URL: http://psearch.en.murata.com/capacitor/product/GRM155R71H104ME14%23.pdf?src-supplier=Avnet; ComponentLink2Description: http://psearch.en.murata.com/capacitor/product/GRM155R71H104ME14%23.pdf?src-supplier=Avnet; ComponentLink3URL: http://components.arrow.com/part/dataview/0323_07177683?src-supplier=Arrow+Europe; ComponentLink3Description: http://components.arrow.com/part/dataview/0323_07177683?src-supplier=Arrow+Europe; ComponentLink4URL: http://www.mouser.com/ds/2/281/c02e-2905.pdf?src-supplier=Mouser; ComponentLink4Description: http://www.mouser.com/ds/2/281/c02e-2905.pdf?src-supplier=Mouser; Supplier Part Number 1: 490-10701-1-ND
C17 = GRM155R61E225KE11D: 0402 2.2 uF 25 V ±10% Tolerance X5R SMT Multilayer Ceramic Capacitor; Manufacturer: Yageo; Manufacturer Part Number: CC0402JRNPO9BN200; Capacitance: 20pF; Tolerance: 5%; Voltage Rating: 50V; Dielectric: C0G; Supplier 1: Digi-Key; Stock 1: 453493; Pricing 1: 1=0.1, 10=0.036, 100=0.0162, 500=0.01156, 1000=0.00908, 2500=0.00825, 5000=0.00759 (USD); Mount: Surface Mount; Case/Package: 0402; Number of Pins: 2; Weight: 2.3E-05oz; Case Code (Metric): 1005; Case Code (Imperial): 0402; Min Operating Temperature: -55°C; Max Operating Temperature: 125°C; Packaging: Tape and Reel; Package Quantity: 1; Voltage Rating (DC): 50V; Termination: SMD/SMT; Composition: Ceramic; Length: 1mm; Width: 0.02inch; Thickness: 0.022inch; Depth: 0.5mm; REACH SVHC: No SVHC; Lead Free: Lead Free; ComponentLink1URL: http://www.yageo.com/documents/recent/UPY-GP_NP0_16V-to-50V_16.pdf?src-supplier=Digi-Key; ComponentLink1Description: http://www.yageo.com/documents/recent/UPY-GP_NP0_16V-to-50V_16.pdf?src-supplier=Digi-Key; ComponentLink2URL: http://www.yageo.com/documents/recent/UPY-GP_NP0_16V-to-50V_16.pdf?src-supplier=Mouser; ComponentLink2Description: http://www.yageo.com/documents/recent/UPY-GP_NP0_16V-to-50V_16.pdf?src-supplier=Mouser; Supplier Part Number 1: 311-1417-1-ND; Supplier 2: Digi-Key; RoHS: Yes; Category: Ceramic Capacitors; Stock 2: 386153; Pricing 2: 1=0.28000, 10=0.19000, 50=0.11380, 100=0.09610, 500=0.06578, 1000=0.05819, 2500=0.05566, 5000=0.05060 (USD); Material: Ceramic; Resistor Type: Ceramic; Height: 0.5mm; RoHS Compliant: Yes; ComponentLink3URL: http://www.mouser.com/ds/2/281/c02e-2905.pdf?src-supplier=Mouser; ComponentLink3Description: http://www.mouser.com/ds/2/281/c02e-2905.pdf?src-supplier=Mouser; ComponentLink4URL: http://search.murata.co.jp/Ceramy/image/img/A01X/G101/ENG/GRM155R61E225KE11-01.pdf?src-supplier=Digi-Key; ComponentLink4Description: http://search.murata.co.jp/Ceramy/image/img/A01X/G101/ENG/GRM155R61E225KE11-01.pdf?src-supplier=Digi-Key; ComponentLink5URL: http://search.murata.co.jp/Ceramy/image/img/A01X/partnumbering_e_01.pdf?src-supplier=Digi-Key; ComponentLink5Description: http://search.murata.co.jp/Ceramy/image/img/A01X/partnumbering_e_01.pdf?src-supplier=Digi-Key; ComponentLink6URL: http://psearch.en.murata.com/capacitor/product/GRM155R61E225KE11%23.pdf?src-supplier=Avnet; ComponentLink6Description: http://psearch.en.murata.com/capacitor/product/GRM155R61E225KE11%23.pdf?src-supplier=Avnet; Supplier Part Number 2: 490-12703-1-ND
C25-C28 = CC0402JRNPO9BN200: CAP CER 20PF 50V C0G/NPO 0402; Manufacturer: Yageo; Tolerance: 5%; Dielectric: C0G; Supplier 1: Digi-Key; Manufacturer Part Number: CC0402JRNPO9BN200; Stock 1: 453493; Pricing 1: 1=0.1, 10=0.036, 100=0.0162, 500=0.01156, 1000=0.00908, 2500=0.00825, 5000=0.00759 (USD); Mount: Surface Mount; Case/Package: 0402; Number of Pins: 2; Weight: 2.3E-05oz; Case Code (Metric): 1005; Case Code (Imperial): 0402; Min Operating Temperature: -55°C; Max Operating Temperature: 125°C; Capacitance: 20pF; Voltage Rating: 50V; Packaging: Tape and Reel; Package Quantity: 1; Voltage Rating (DC): 50V; Termination: SMD/SMT; Composition: Ceramic; Length: 1mm; Width: 0.02inch; Thickness: 0.022inch; Depth: 0.5mm; REACH SVHC: No SVHC; Lead Free: Lead Free; ComponentLink1URL: http://www.yageo.com/documents/recent/UPY-GP_NP0_16V-to-50V_16.pdf?src-supplier=Digi-Key; ComponentLink1Description: http://www.yageo.com/documents/recent/UPY-GP_NP0_16V-to-50V_16.pdf?src-supplier=Digi-Key; ComponentLink2URL: http://www.yageo.com/documents/recent/UPY-GP_NP0_16V-to-50V_16.pdf?src-supplier=Mouser; ComponentLink2Description: http://www.yageo.com/documents/recent/UPY-GP_NP0_16V-to-50V_16.pdf?src-supplier=Mouser; Supplier Part Number 1: 311-1417-1-ND
L2 = NLCV25T-100K-EFRD: FIXED IND 10UH 360MA 1.32OHM SMD; Manufacturer: Taiyo Yuden; Manufacturer Part Number: MAKK2016T2R2M; Core Material: Metal; Tolerance: 20%; Shielding: Shielded; Inductance: 2.2uH; Current Rating: 1.5A; DC Resistance (DCR): 160mR; Test Frequency: 2MHz; Self Resonant Frequency: 30MHz; Supplier 1: Mouser; RoHS: Yes; Category: Fixed Inductors; Stock 1: 64320; Pricing 1: 1=0.27000, 10=0.17200, 50=0.17200, 100=0.14000, 1000=0.10600, 10000=0.09200 (USD); Mount: Surface Mount; Case/Package: 0806; Case Code (Metric): 2016; Case Code (Imperial): 0806; Min Operating Temperature: -40°C; Max Operating Temperature: 105°C; Packaging: Tape and Reel; Package Quantity: 3000; Resistor Type: Wirewound; Saturation Current: 1.5A; Max DC Current: 1.5A; Termination: SMD/SMT; Length: 0.079inch; Width: 0.063inch; Height: 1mm; Height - Seated (Max): 0.039inch; Depth: 1.6mm; Radiation Hardening: No; Halogen Free: Halogen Free; RoHS Compliant: Yes; ComponentLink1URL: https://datasheet.ciiva.com/30014/makk2016t2r2m-ss-30014449.pdf?src-supplier=Avnet; ComponentLink1Description: https://datasheet.ciiva.com/30014/makk2016t2r2m-ss-30014449.pdf?src-supplier=Avnet; Supplier Part Number 1: 963-MAKK2016T2R2M; Supplier 2: Digi-Key; Stock 2: 6246; Pricing 2: 1=0.33000, 10=0.29000, 25=0.25400, 50=0.21780, 100=0.19960, 250=0.18152, 500=0.17060, 1000=0.13068 (USD); Ratings: AEC-Q200; ComponentLink2URL: https://product.tdk.com/info/en/catalog/datasheets/inductor_automotive_decoupling_nlcv25-efrd_en.pdf?ref_disty=digikey&src-supplier=Digi-Key; ComponentLink2Description: https://product.tdk.com/info/en/catalog/datasheets/inductor_automotive_decoupling_nlcv25-efrd_en.pdf?ref_disty=digikey&src-supplier=Digi-Key; ComponentLink3URL: https://product.tdk.com/info/en/catalog/datasheets/inductor_automotive_decoupling_nlcv25-efrd_en.pdf?src-supplier=Digi-Key; ComponentLink3Description: https://product.tdk.com/info/en/catalog/datasheets/inductor_automotive_decoupling_nlcv25-efrd_en.pdf?src-supplier=Digi-Key; Supplier Part Number 2: 445-181381-1-ND
LED1 = XZVG68W-2: LED GREEN CLEAR CHIP SMD; Manufacturer: SunLED; Lens Color: Colorless; Luminous Intensity: 49mcd; Test Current: 20mA; Viewing Angle: 120°; Dominant Wavelength: 570nm; Forward Voltage: 2.1V; Supplier 1: Digi-Key; Manufacturer Part Number: XZVG68W-2; Stock 1: 4185; Pricing 1: 1=0.5, 10=0.36, 100=0.16, 500=0.112, 1000=0.092 (USD); Mount: Surface Mount; Case/Package: 0402; Color: Green; Case Code (Metric): 1005; Case Code (Imperial): 0402; Packaging: Tape and Reel; Lens Transparency: Clear; Length: 1mm; Height: 0.6mm; Width: 0.5mm; ComponentLink1URL: http://www.sunledusa.com/products/spec/XZVG68W-2.pdf?src-supplier=Digi-Key; ComponentLink1Description: http://www.sunledusa.com/products/spec/XZVG68W-2.pdf?src-supplier=Digi-Key; ComponentLink2URL: https://www.sunledusa.com/products/spec/XZVG68W-2.pdf?src-supplier=Digi-Key; ComponentLink2Description: https://www.sunledusa.com/products/spec/XZVG68W-2.pdf?src-supplier=Digi-Key; Supplier Part Number 1: 1497-1219-6-ND
R5 R6 = RC0402FR-0710KL: as R4 on sheet Switching-Regulators; Supplier 1: Digi-Key; Manufacturer Part Number: RC0402FR-0710KL; Stock 1: 60122563; Pricing 1: 1=0.1, 10=0.016, 100=0.0064, 1000=0.00289, 2500=0.00251, 5000=0.00207 (USD); Case/Package: 0402; Number of Pins: 2; Case Code (Imperial): 0402; Case Code (Metric): 1005; Min Operating Temperature: -55°C; Max Operating Temperature: 155°C; Composition: Thick Film; Tolerance: 1%; Packaging: Tape and Reel; Voltage Rating: 50V; Termination: SMD/SMT; Military Standard: Not; Working Voltage: 50V; Number of Terminations: 2; Length: 1mm; Height: 0.32mm; Width: 0.5mm; Depth: 0.5mm; Lead Pitch: 0.2mm; REACH SVHC: No SVHC; Lead Free: Lead Free; ComponentLink1URL: http://www.farnell.com/datasheets/2167052.pdf?src-supplier=Element14; ComponentLink1Description: http://www.farnell.com/datasheets/2167052.pdf?src-supplier=Element14; ComponentLink2URL: http://www.farnell.com/datasheets/1686128.pdf?src-supplier=Element14; ComponentLink2Description: http://www.farnell.com/datasheets/1686128.pdf?src-supplier=Element14; ComponentLink3URL: http://www.farnell.com/datasheets/1784430.pdf?src-supplier=Element14; ComponentLink3Description: http://www.farnell.com/datasheets/1784430.pdf?src-supplier=Element14; ComponentLink4URL: http://www.yageo.com/documents/recent/PYu-RC_Group_51_RoHS_L_9.pdf?src-supplier=Mouser; ComponentLink4Description: http://www.yageo.com/documents/recent/PYu-RC_Group_51_RoHS_L_9.pdf?src-supplier=Mouser; Supplier Part Number 1: 311-10.0KLRDKR-ND
R7 = FRC0402J1R0 TS: 62.5mW Thick Film Resistors 50V ±5% ±200ppm/℃ 1Ω -55℃~+155℃ 0402 Chip Resistor - Surface Mount ROHS; Manufacturer: Panasonic; Manufacturer Part Number: ERJ-2GEJ102X; Resistance: 1kR; Temperature Coefficient: 200ppm/°C; Power Rating: 100mW; Supplier 1: Digi-Key; Stock 1: 3855795; Pricing 1: 1=0.1, 10=0.032, 100=0.0129, 1000=0.00578, 2500=0.00502, 5000=0.00414 (USD); Mount: Surface Mount; Case/Package: 0402; Contact Plating: Tin; Case Code (Metric): 1005; Case Code (Imperial): 0402; Min Operating Temperature: -55°C; Max Operating Temperature: 155°C; Tolerance: 5%; Composition: Thick Film; Packaging: Tape and Reel; Voltage Rating: 50V; Package Quantity: 1; Number of Terminations: 2; Termination: SMD/SMT; Military Standard: Not; Max Power Dissipation: 100mW; Voltage Rating (DC): 50V; Features: Automotive AEC-Q200; Working Voltage: 50V; Length: 1mm; Height: 0.35mm; Width: 0.02inch; Depth: 0.5mm; Radiation Hardening: No; REACH SVHC: No SVHC; Lead Free: Lead Free; ComponentLink1URL: https://industrial.panasonic.com/cdbs/www-data/pdf/RDA0000/AOA0000C301.pdf?src-supplier=Future+Electronics; ComponentLink1Description: https://industrial.panasonic.com/cdbs/www-data/pdf/RDA0000/AOA0000C301.pdf?src-supplier=Future+Electronics; ComponentLink2URL: http://www.jameco.com/Jameco/Products/ProdDS/1986781.pdf?src-supplier=Jameco; ComponentLink2Description: http://www.jameco.com/Jameco/Products/ProdDS/1986781.pdf?src-supplier=Jameco; ComponentLink3URL: http://www.farnell.com/datasheets/2059623.pdf?src-supplier=Farnell; ComponentLink3Description: http://www.farnell.com/datasheets/2059623.pdf?src-supplier=Farnell; ComponentLink4URL: http://industrial.panasonic.com/www-data/pdf/AOA0000/AOA0000CE1.pdf?src-supplier=Avnet; ComponentLink4Description: http://industrial.panasonic.com/www-data/pdf/AOA0000/AOA0000CE1.pdf?src-supplier=Avnet; ComponentLink5URL: http://www.alliedelec.com/m/d/51cd0790071e1666bdb9d00c57fcf960.pdf?src-supplier=Allied+Electronics; ComponentLink5Description: http://www.alliedelec.com/m/d/51cd0790071e1666bdb9d00c57fcf960.pdf?src-supplier=Allied+Electronics; ComponentLink6URL: http://industrial.panasonic.com/www-data/pdf/AOA0000/AOA0000CE1.pdf?src-supplier=Avnet+Europe; ComponentLink6Description: http://industrial.panasonic.com/www-data/pdf/AOA0000/AOA0000CE1.pdf?src-supplier=Avnet+Europe; ComponentLink7URL: http://www.farnell.com/datasheets/2059623.pdf?src-supplier=Element14; ComponentLink7Description: http://www.farnell.com/datasheets/2059623.pdf?src-supplier=Element14; ComponentLink8URL: http://industrial.panasonic.com/cdbs/www-data/pdf/RDA0000/AOA0000C301.pdf?src-supplier=Farnell; ComponentLink8Description: http://industrial.panasonic.com/cdbs/www-data/pdf/RDA0000/AOA0000C301.pdf?src-supplier=Farnell; ComponentLink9URL: http://industrial.panasonic.com/www-data/pdf/AOA0000/AOA0000CE1.pdf?src-supplier=Avnet+Asia; ComponentLink9Description: http://industrial.panasonic.com/www-data/pdf/AOA0000/AOA0000CE1.pdf?src-supplier=Avnet+Asia; Supplier Part Number 1: P1.0KJCT-ND
R8 = ERJPA2F1003X: RES SMD 100K OHM 1% 1/5W 0402; Manufacturer: Panasonic; Manufacturer Part Number: ERJ-PA2F1003X; Resistance: 100kR; Power Rating: 200mW; Voltage Rating: 50V; Temperature Coefficient: 100ppm/°C; Supplier 1: Digi-Key; Stock 1: 8829; Pricing 1: 1=0.21, 10=0.175, 100=0.0686, 1000=0.02871, 2500=0.02632, 5000=0.02393 (USD); Case/Package: 0402; Case Code (Metric): 1005; Case Code (Imperial): 0402; Min Operating Temperature: -55°C; Max Operating Temperature: 155°C; Packaging: Cut Tape; Composition: Thick Film; Number of Terminations: 2; Tolerance: 1%; Max Power Dissipation: 200mW; Voltage Rating (DC): 50V; Features: Automotive AEC-Q200; Length: 0.039inch; Height: 0.016inch; Width: 0.02inch; REACH SVHC: Unknown; ComponentLink1URL: http://www.farnell.com/datasheets/2051174.pdf?src-supplier=Element14; ComponentLink1Description: http://www.farnell.com/datasheets/2051174.pdf?src-supplier=Element14; ComponentLink2URL: https://industrial.panasonic.com/ww/system/files/data/download/catalog/id_fixed-resistors_e_1.pdf?src-supplier=Digi-Key; ComponentLink2Description: https://industrial.panasonic.com/ww/system/files/data/download/catalog/id_fixed-resistors_e_1.pdf?src-supplier=Digi-Key; Supplier Part Number 1: P17236CT-ND
R9 = ERJ2GEJ680X: Res Thick Film 0402 68 Ohm 5% 1/10W ±200ppm/°C Molded SMD Punched Carrier T/R; Manufacturer: Yageo; Manufacturer Part Number: AC0402FR-07806RL; Resistance: 806R; Tolerance: 1%; Max Power Dissipation: 63mW; Temperature Coefficient: 100ppm/°C; Power Rating: 100mW; Voltage Rating: 50V; Supplier 1: Arrow Electronics; RoHS: Yes; Category: Chip SMD Resistors; Stock 1: 6997; Pricing 1: 1=0.04340, 10=0.00890, 25=0.00880, 100=0.00370, 250=0.00360, 1000=0.00210, 3000=0.00140, 6000=0.00110 (USD); Case/Package: 0402; Min Operating Temperature: -55°C; Max Operating Temperature: 155°C; Packaging: Tape and Reel; Resistor Type: Thick Film; Number of Terminations: 2; Features: Moisture Resistant,Automotive AEC-Q200; Length: 0.039inch; Width: 0.02inch; Height: 0.015inch; RoHS Compliant: Yes; ComponentLink1URL: http://www.yageo.com/NewPortal/yageodocoutput?fileName=/pdf/R-Chip/PYu-AC_51_RoHS_L_6.pdf&src-supplier=Digi-Key; ComponentLink1Description: http://www.yageo.com/NewPortal/yageodocoutput?fileName=/pdf/R-Chip/PYu-AC_51_RoHS_L_6.pdf&src-supplier=Digi-Key; ComponentLink2URL: https://www.yageo.com/upload/media/product/productsearch/datasheet/rchip/PYu-AC_51_RoHS_L_7.pdf?src-supplier=Digi-Key; ComponentLink2Description: https://www.yageo.com/upload/media/product/productsearch/datasheet/rchip/PYu-AC_51_RoHS_L_7.pdf?src-supplier=Digi-Key; Supplier Part Number 1: AC0402FR-07806RL; Supplier 2: Digi-Key; Stock 2: 2535316; Pricing 2: 1=0.10000, 10=0.03100, 100=0.01250, 1000=0.00563, 2500=0.00489, 5000=0.00404 (USD); Mount: Surface Mount; Contact Plating: Tin; Case Code (Imperial): 0402; Case Code (Metric): 1005; Size Code: 0402; Package Quantity: 1; Termination: SMD/SMT; Voltage Rating (DC): 50V; Series: ERJ; Technology: THICK FILM; Resistance Tolerance: 5%; Construction: Rectangular; Depth: 0.5mm; Radiation Hardening: No; REACH SVHC: No SVHC; Military Standard: Not; Lead Free: Lead Free; ComponentLink3URL: https://datasheet.ciiva.com/11821/0900766b80f806dd-11821328.pdf?src-supplier=RSComponents; ComponentLink3Description: https://datasheet.ciiva.com/11821/0900766b80f806dd-11821328.pdf?src-supplier=RSComponents; ComponentLink4URL: https://datasheet.ciiva.com/46377/1678796-46377565.pdf?src-supplier=Element14; ComponentLink4Description: https://datasheet.ciiva.com/46377/1678796-46377565.pdf?src-supplier=Element14; ComponentLink5URL: https://datasheet.ciiva.com/28514/1678796-28514168.pdf?src-supplier=Element14; ComponentLink5Description: https://datasheet.ciiva.com/28514/1678796-28514168.pdf?src-supplier=Element14; ComponentLink6URL: https://datasheet.ciiva.com/16758/70260739-16758341.pdf?src-supplier=Allied+Electronics; ComponentLink6Description: https://datasheet.ciiva.com/16758/70260739-16758341.pdf?src-supplier=Allied+Electronics; ComponentLink7URL: https://datasheet.ciiva.com/16770/70260739-16770309.pdf?src-supplier=Allied+Electronics; ComponentLink7Description: https://datasheet.ciiva.com/16770/70260739-16770309.pdf?src-supplier=Allied+Electronics; Supplier Part Number 2: P4.7KJDKR-ND; Supplier 3: Digi-Key; Stock 3: 649597; Pricing 3: 1=0.10000, 10=0.03100, 100=0.01250, 1000=0.00563, 2500=0.00489, 5000=0.00404 (USD); Weight: 2.8E-05oz; ComponentLink8URL: https://datasheet.ciiva.com/11821/0900766b80f806dd-11821373.pdf?src-supplier=RSComponents; ComponentLink8Description: https://datasheet.ciiva.com/11821/0900766b80f806dd-11821373.pdf?src-supplier=RSComponents; ComponentLink9URL: https://datasheet.ciiva.com/5860/1500035-5860645.pdf?src-supplier=Farnell; ComponentLink9Description: https://datasheet.ciiva.com/5860/1500035-5860645.pdf?src-supplier=Farnell; ComponentLink10URL: https://datasheet.ciiva.com/28686/1678796-28686917.pdf?src-supplier=Element14; ComponentLink10Description: https://datasheet.ciiva.com/28686/1678796-28686917.pdf?src-supplier=Element14; ComponentLink11URL: https://datasheet.ciiva.com/9187/aoa0000ce1-9187990.pdf?src-supplier=Avnet; ComponentLink11Description: https://datasheet.ciiva.com/9187/aoa0000ce1-9187990.pdf?src-supplier=Avnet; ComponentLink12URL: https://datasheet.ciiva.com/30182/4aoa0000ce1-30182248.pdf?src-supplier=Onlinecomponents.com; ComponentLink12Description: https://datasheet.ciiva.com/30182/4aoa0000ce1-30182248.pdf?src-supplier=Onlinecomponents.com; ComponentLink13URL: https://datasheet.ciiva.com/46377/1500035-46377370.pdf?src-supplier=Element14; ComponentLink13Description: https://datasheet.ciiva.com/46377/1500035-46377370.pdf?src-supplier=Element14; ComponentLink14URL: https://datasheet.ciiva.com/16775/70260739-16775723.pdf?src-supplier=Allied+Electronics; ComponentLink14Description: https://datasheet.ciiva.com/16775/70260739-16775723.pdf?src-supplier=Allied+Electronics; ComponentLink15URL: https://datasheet.ciiva.com/46389/1500035-46389070.pdf?src-supplier=Element14; ComponentLink15Description: https://datasheet.ciiva.com/46389/1500035-46389070.pdf?src-supplier=Element14; Supplier Part Number 3: P68JCT-ND
SB1 SB2 SB4 SB5 = Solder Bridge: Solder Bridge ON
SW1 = TS-1185EC-C-D-B: 3mm 2mm Round Button 50mA Top3.65mm SPST 12V SMD Tactile Switches; Manufacturer: XKB; Manufacturer Part No: TS-1185EC-C-D-B; Package: Custom; ComponentLink1Description: LCSC; ComponentLink1URL: https://lcsc.com/product-detail/Tactile-Switches_XKB-Connectivity-TS-1185EC-C-D-B_C318893.html
U5 = ATSAM4S8BA-MU: MCU 32-bit SAM4S ARM Cortex M4 RISC 512KB Flash 1.2V/3.3V 64-Pin QFN EP Tray; Manufacturer: Microchip; Interface: I2C,SPI,USB,IrDA,UART,USART; Peripherals: Brown-out Detect/Reset,POR,PWM,WDT,DMA; Frequency: 120MHz; Oscillator Type: Internal; Number of I/Os: 47; Supplier 1: Digi-Key; Manufacturer Part Number: ATSAM4S8BA-MU; RoHS: Yes; Category: Microcontrollers; Pricing 1: 1=6.23000, 25=5.66960, 100=5.13000 (USD); Case/Package: QFN; Min Operating Temperature: -40°C; Max Operating Temperature: 85°C; Memory Type: FLASH; Packaging: Tray; Core Architecture: ARM; Memory Size: 512KB; RoHS Compliant: Yes; ComponentLink1URL: http://www.microchip.com/mymicrochip/filehandler.aspx?ddocname=en590343&src-supplier=Digi-Key; ComponentLink1Description: http://www.microchip.com/mymicrochip/filehandler.aspx?ddocname=en590343&src-supplier=Digi-Key; Supplier Part Number 1: ATSAM4S8BA-MU-ND
X1 = X321532768KGD2SI: 32.768kHz SMD Crystal Resonator 12.5pF ±20ppm -40℃~+85℃ SMD3215-2P Crystals ROHS; Manufacturer: Yangxing Tech; Manufacturer Part Number: X321532768KGD2SI; Footprint: Custom; ComponentLink1Description: LCSC; ComponentLink1URL: https://www.lcsc.com/product-detail/Crystals_Yangxing-Tech-X321532768KGD2SI_C620155.html
X2 = X322516MOB4SI: 16MHz SMD Crystal Resonator 12pF ±10ppm ±30ppm -40℃~+85℃ SMD3225-4P Crystals ROHS; Manufacturer: Yangxing Tech; Package: SMD3225-4P; Frequency: 16MHz; Crystal Type: SMD Crystal Resonator; Frequency Tolerance: ±10ppm; Load Capacitance: 12pF; Operating Temperature: -40℃~+85℃